# Altium schematic sheet USB-Sheet.SchDoc
size 420 x 297 mm; SheetNumber: 5; SheetTotal: 7
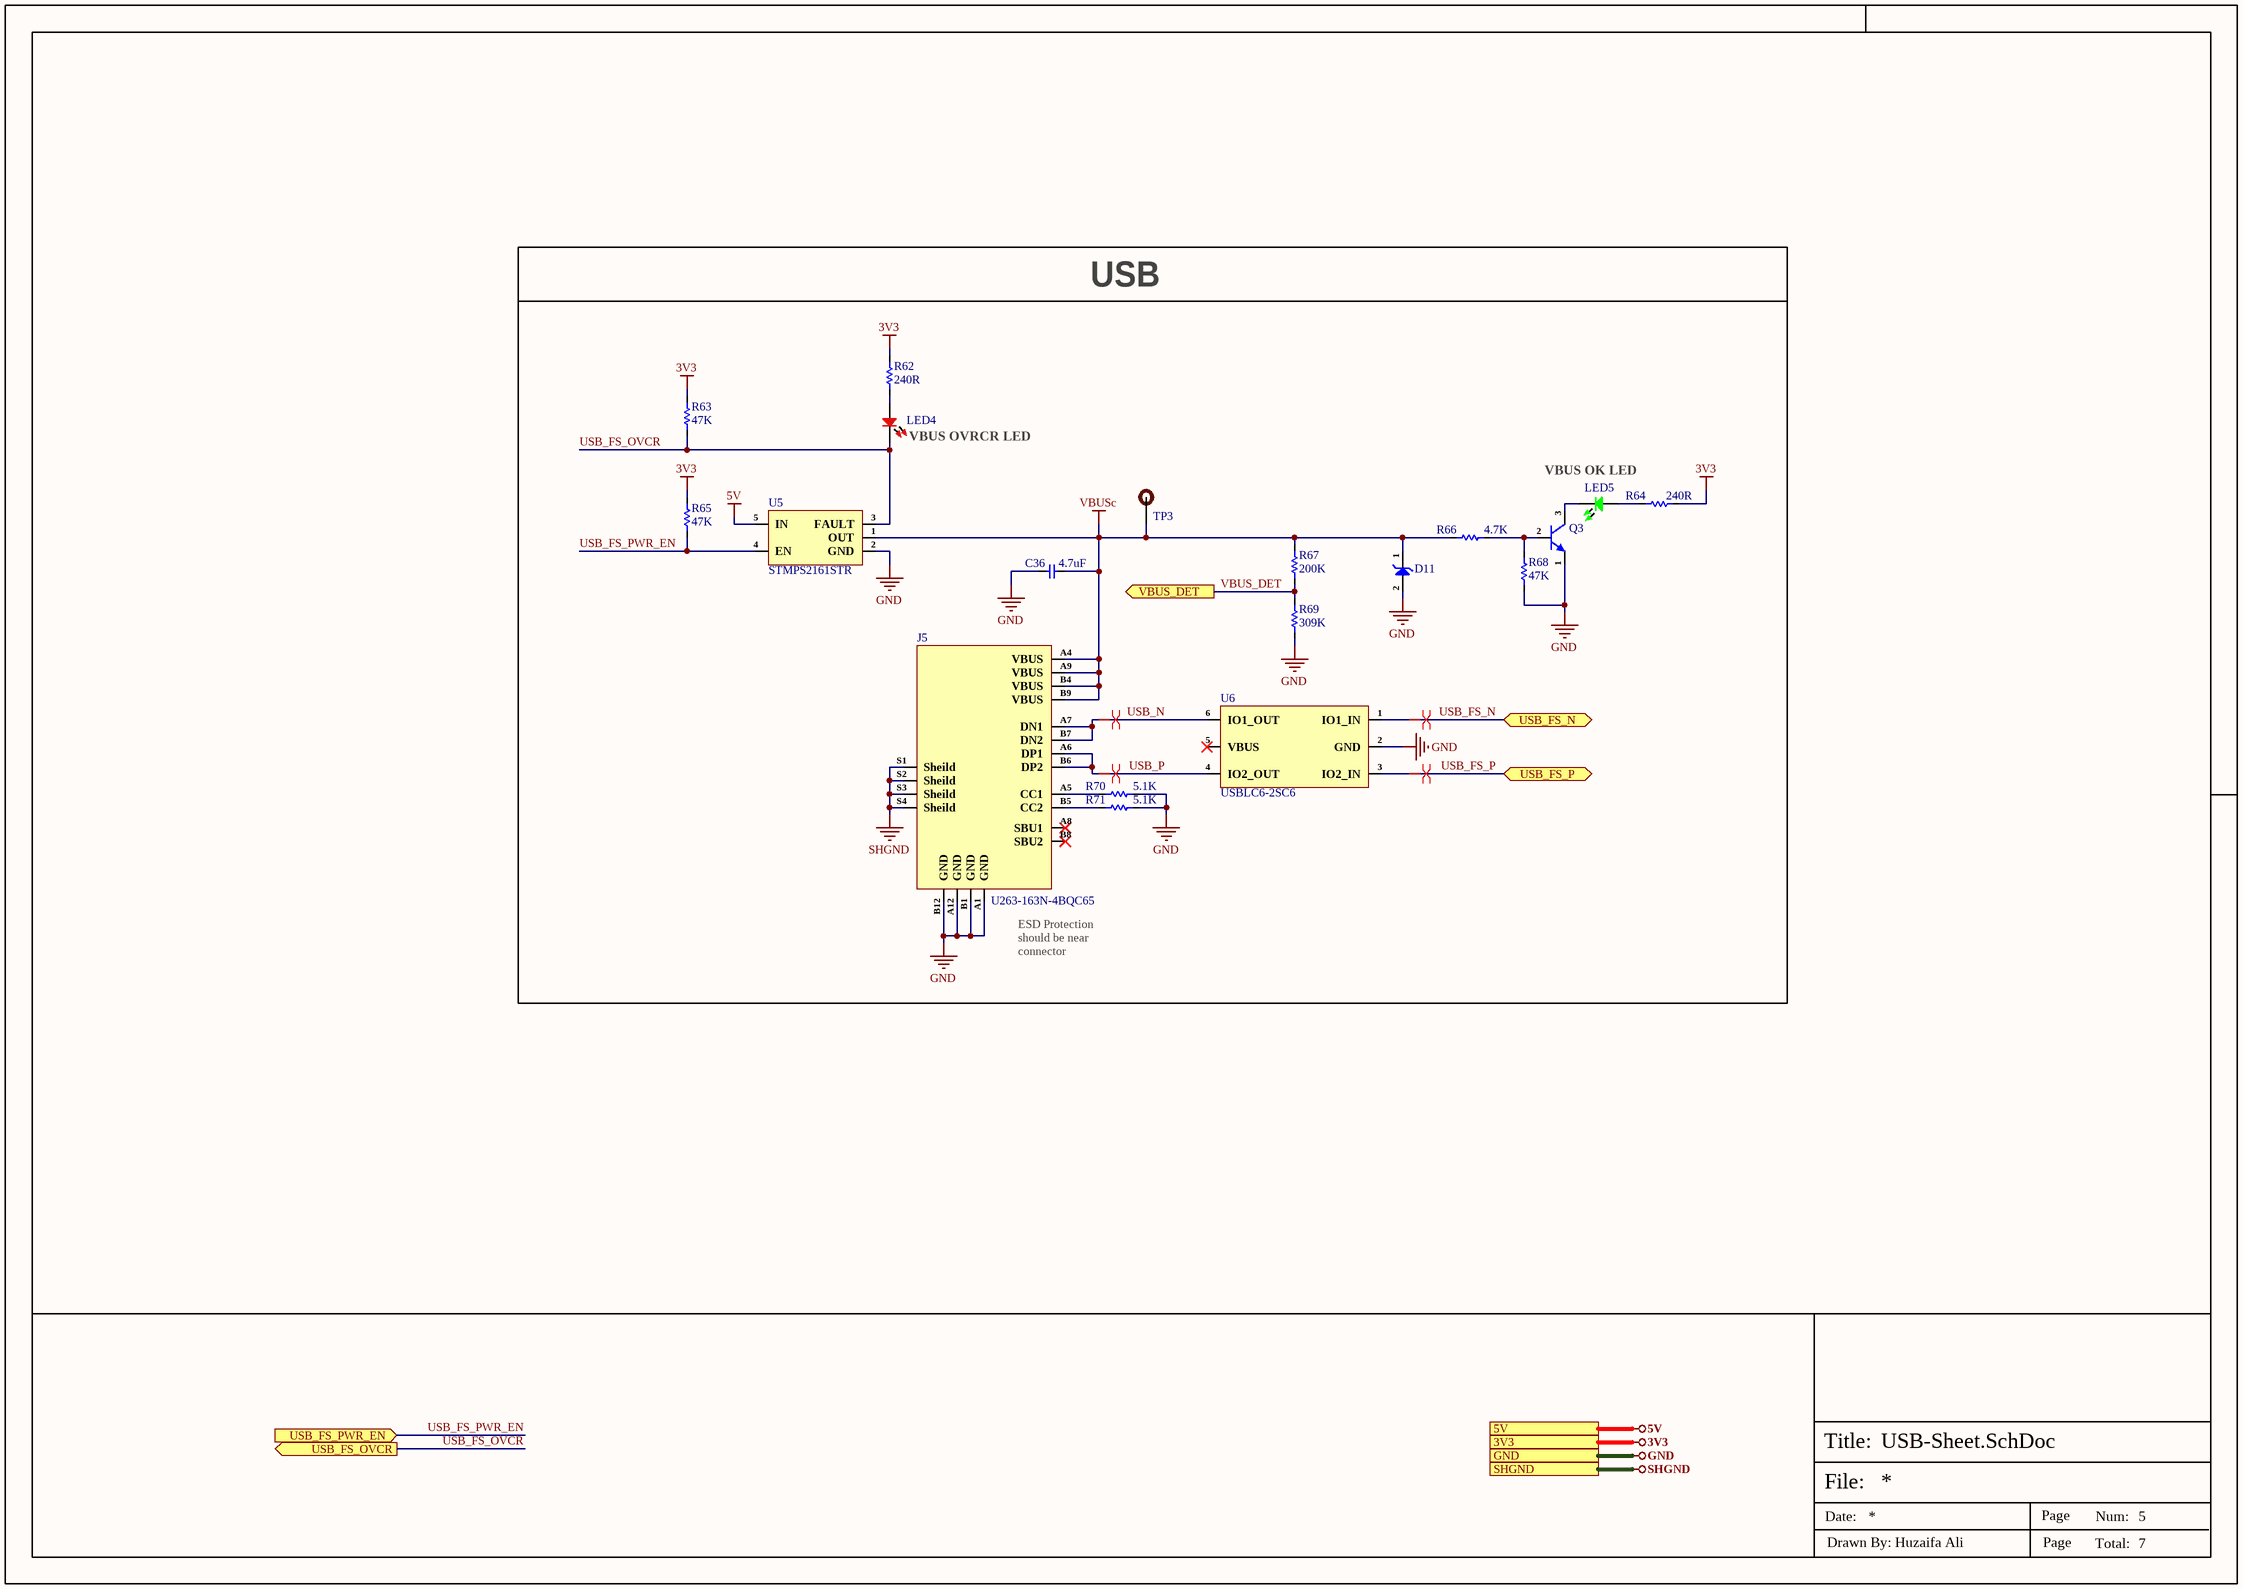
[diagram p0: USB-Sheet.SchDoc]

## Parts
C36  4.7uF  [Cap-0402]
D11  ESDA7P60-1U1M  [Diode 1610]  (value not drawn)
J5  U263-163N-4BQC65  [U263-163N-4BQC65]
LED4  RED  [LED-0603]  (value not drawn)
LED5  Emerald  [LED-0603]  (value not drawn)
Q3  MMBT3904  [SOT-23]  (value not drawn)
R62  240R  [Res-0402]
R63  47K  [Res-0402]
R64  240R  [Res-0402]
R65  47K  [Res-0402]
R66  4.7K  [Res-0402]
R67  200K  [Res-0402]
R68  47K  [Res-0402]
R69  309K  [Res-0402]
R70  5.1K  [Res-0402]
R71  5.1K  [Res-0402]
TP3  TEST POINT  [Test-point]  (value not drawn)  (no BOM)
U5  STMPS2161STR  [SOT-23-5]
U6  USBLC6-2SC6  [SOT-23-6]

## Ports
3V3 (see Top-Sheet[5B], BLDC-Driver-Sheet[5D], Comms-Sheet[4D], Controller-Sheet-1[4D], Controller-Sheet-2[4D], Power-Sheet[4D]), 5V (see Top-Sheet[5B], BLDC-Driver-Sheet[5D], Comms-Sheet[4D], Controller-Sheet-2[4D], Power-Sheet[4D]), GND (see Top-Sheet[5B], BLDC-Driver-Sheet[5D], Comms-Sheet[4D], Controller-Sheet-1[4D], Controller-Sheet-2[4D], Power-Sheet[4D]), SHGND (see Top-Sheet[5B], Power-Sheet[4D]), USB_FS_N (bidir, see Top-Sheet[5B], Controller-Sheet-2[2B]), USB_FS_OVCR (out, see Top-Sheet[5B], Controller-Sheet-2[2B]), USB_FS_P (bidir, see Top-Sheet[5B], Controller-Sheet-2[2B]), USB_FS_PWR_EN (in, see Top-Sheet[5B], Controller-Sheet-2[2B]), VBUS_DET (out, see Top-Sheet[5B], Controller-Sheet-2[2B])

## Nets
3V3: R62.2 R63.2 R64.2 R65.2 ; port 3V3
5V: U5.5(IN) ; port 5V
GND: C36.2 D11.2(A) J5.A1(GND) J5.A12(GND) J5.B1(GND) J5.B12(GND) Q3.1(E) R68.1 R69.1 R70.2 R71.2 U5.2(GND) U6.2(GND) ; port GND
SHGND: J5.S1(Sheild) J5.S2(Sheild) J5.S3(Sheild) J5.S4(Sheild) ; port SHGND
VBUSc: C36.1 D11.1(K) J5.A4(VBUS) J5.A9(VBUS) J5.B4(VBUS) J5.B9(VBUS) R66.1 R67.2 TP3.1 U5.1(OUT)
USB_FS_N: U6.1(IO1_IN) ; port USB_FS_N
USB_FS_OVCR: LED4.2 R63.1 U5.3(FAULT) ; port USB_FS_OVCR
USB_FS_P: U6.3(IO2_IN) ; port USB_FS_P
USB_FS_PWR_EN: R65.1 U5.4(EN) ; port USB_FS_PWR_EN
USB_N: J5.A7(DN1) J5.B7(DN2) U6.6(IO1_OUT)
USB_P: J5.A6(DP1) J5.B6(DP2) U6.4(IO2_OUT)
VBUS_DET: R67.1 R69.2 ; port VBUS_DET
NetJ5_A5: J5.A5(CC1) R70.1
NetJ5_B5: J5.B5(CC2) R71.1
NetLED4_1: LED4.1 R62.1
NetLED5_1: LED5.1 R64.1
NetLED5_2: LED5.2 Q3.3(C)
NetQ3_2: Q3.2(B) R66.2 R68.2

Not connected (* = marked no-connect by the designer): J5 A8(SBU1)* B8(SBU2)*; U6 5(VBUS)*

## Layout directives
differential pair; differential pair class DIFF_USB: USB_FS_N, USB_FS_P, USB_N, USB_P

## Notes on the sheet
- USB
- VBUS OVRCR LED
- VBUS OK LED
- (near J5) ESD Protection should be near connector
- File:
- Title:
- Date:
- Page
- Num:
- Total:
- Drawn By: Huzaifa Ali

## Library data of the parts
C36 = CC0402KRX5R6BB475: CAP CER 4.7UF 10V X5R 0402; Manufacturer: Yageo; Tolerance: 10%; Supplier 1: Farnell; Manufacturer Part Number: CC0402KRX5R6BB475; RoHS: Yes; Category: Ceramic Capacitors; Stock 1: 20000; Pricing 1: 10000=0.02310, 50000=0.02100 (GBP); Mount: Surface Mount; Case/Package: 0402; Case Code (Imperial): 0402; Case Code (Metric): 1005; Min Operating Temperature: -55°C; Max Operating Temperature: 85°C; Packaging: Cut Tape; Capacitance: 4.7uF; Voltage Rating: 10V; RoHS Compliant: Yes; ComponentLink1URL: http://www.yageo.com/documents/recent/UPY-GPHC_X5R_4V-to-50V_25.pdf?src-supplier=Digi-Key; ComponentLink1Description: http://www.yageo.com/documents/recent/UPY-GPHC_X5R_4V-to-50V_25.pdf?src-supplier=Digi-Key; Supplier Part Number 1: 3871698; LCSC Part Number: C326586
D11 = ESDA7P60-1U1M: TVS DIODE 5VWM 11.6VC 1610; Manufacturer: STMicroelectronics; Item Type: TVS Diodes; Number of Unidirectional Channels: 1; Reverse Standoff Voltage: 5V; Min Breakdown Voltage: 6.4V; Peak Pulse Power: 700W; Power Line Protection: No; Polarity: Unidirectional; Max Breakdown Voltage: 7.2V; Peak Pulse Current: 60A; Diode Type: ZENER; Supplier: Mouser; LCSC Part Number: C1975146; Manufacturer Part Number: ESDA7P60-1U1M; RoHS: Yes; Stock: 24694; Pricing: 1=0.37, 10=0.245, 50=0.245, 100=0.166, 1000=0.097, 10000=0.077 (USD); Mounting Technology: Surface Mount; Case/Package: 0603; Pins: 2; Case Code (Imperial): 0603; Case Code (Metric): 1610; Min Operating Temperature: -55°C; Max Operating Temperature: 150°C; Packaging: Cut Tape; Series: ESDA; Reach SVHC Compliant: No; RoHS Compliant: Yes; ComponentLink1URL: http://www.farnell.com/datasheets/2041290.pdf?src-supplier=Farnell; ComponentLink1Description: http://www.farnell.com/datasheets/2041290.pdf?src-supplier=Farnell; ComponentLink2URL: http://www.farnell.com/datasheets/2041290.pdf?src-supplier=Element14; ComponentLink2Description: http://www.farnell.com/datasheets/2041290.pdf?src-supplier=Element14; ComponentLink3URL: http://www.st.com/content/ccc/resource/technical/document/datasheet/44/e9/26/44/42/ee/4f/e5/DM00139972.pdf/files/DM00139972.pdf/jcr:content/translations/en.DM00139972.pdf?src-supplier=Digikey; ComponentLink3Description: http://www.st.com/content/ccc/resource/technical/document/datasheet/44/e9/26/44/42/ee/4f/e5/DM00139972.pdf/files/DM00139972.pdf/jcr:content/translations/en.DM00139972.pdf?src-supplier=Digikey
J5 = U263-163N-4BQC65: 5A 1 16P Mother -25℃~+85℃ Type-C SMD USB Connectors ROHS; Manufacturer: XKB Connection; Manufacturer Part Number: U263-163N-4BQC65; Package: SMD; LCSC Part Number: C2938598; Item Type: USB Connectors; ComponentLink1Description: LCSC; ComponentLink1URL: https://www.lcsc.com/product-detail/USB-Connectors_XKB-Connection-U263-163N-4BQC65_C2938598.html
LED4 = NCD0603R3: RED LED 0603 Light Emitting Diodes; Manufacturer: Foshan NationStar Optoelectronics; Manufacturer Part Number: NCD0603R3; Package: 0603; Item Type: LED; LCSC Part Number: C3151730; ComponentLink1Description: LCSC; ComponentLink1URL: https://www.lcsc.com/product-detail/Light-Emitting-Diodes-LED_Foshan-NationStar-Optoelectronics-NCD0603R3_C3151730.html
LED5 = NCD0603G2: Emerald 0603 Light Emitting Diodes (LED) ROHS; Manufacturer: Foshan NationStar Optoelectronics; Manufacturer Part Number: NCD0603G2; Package: 0603; LCSC Part Number: C87326; Item Type: LED; ComponentLink1Description: LCSC; ComponentLink1URL: https://www.lcsc.com/product-detail/Light-Emitting-Diodes-LED_Foshan-NationStar-Optoelectronics-NCD0603G2_C87326.html
Q3 = MMBT3904: 40V 200mW 100 200mA NPN SOT-23 Bipolar (BJT) ROHS; Manufacturer: ElecSuper; Item Type: (BJT); Manufacturer Part Number: MMBT3904; Package: SOT-23; LCSC Part Number: C5249683; ComponentLink1Description: LCSC; ComponentLink1URL: https://www.lcsc.com/product-detail/Bipolar-BJT_ElecSuper-MMBT3904_C5249683.html
R62 R64 = RC0402FR-07240RL: RES 240 OHM 1% 1/16W 0402; Manufacturer: Yageo; Item Type: Resistors; Power Rating: 63mW; Temperature Coefficient: 100ppm/°C; Voltage Rating (DC): 50V; Supplier 1: Mouser; Manufacturer Part Number: RC0402FR-07240RL; RoHS: Yes; Stock 1: 1903202; Pricing 1: 1=0.10000, 10=0.01200, 50=0.01200, 100=0.00500, 1000=0.00300, 10000=0.00100 (USD); Case/Package: 0402; Case Code (Metric): 1005; Case Code (Imperial): 0402; Size Code: 0402; Min Operating Temperature: -55°C; Max Operating Temperature: 155°C; Resistance: 240R; Tolerance: 1%; Packaging: Tape and Reel; Resistor Type: Thick Film; Voltage Rating: 50V; Package Quantity: 1; Number of Terminations: 2; Termination: SMD/SMT; Max Power Dissipation: 63mW; Features: Moisture Resistant; Series: RC; Construction: Rectangular; Resistance Tolerance: 1%; Length: 1mm; Width: 0.02inch; Height: 0.016inch; Depth: 0.5mm; REACH SVHC: Unknown; Lead Free: Lead Free; RoHS Compliant: Yes; Military Standard: Not; ComponentLink1URL: https://datasheet.ciiva.com/7849/1018594-7849915.pdf?src-supplier=Element14; ComponentLink1Description: https://datasheet.ciiva.com/7849/1018594-7849915.pdf?src-supplier=Element14; ComponentLink2URL: https://datasheet.ciiva.com/7849/1018594-7849916.pdf?src-supplier=Element14; ComponentLink2Description: https://datasheet.ciiva.com/7849/1018594-7849916.pdf?src-supplier=Element14; ComponentLink3URL: https://datasheet.ciiva.com/2519/pyu-r-int-thick-7-2519157.pdf?src-supplier=Digi-Key; ComponentLink3Description: https://datasheet.ciiva.com/2519/pyu-r-int-thick-7-2519157.pdf?src-supplier=Digi-Key; ComponentLink4URL: https://datasheet.ciiva.com/2519/pyu-r-int-thick-7-2519158.pdf?src-supplier=Digi-Key; ComponentLink4Description: https://datasheet.ciiva.com/2519/pyu-r-int-thick-7-2519158.pdf?src-supplier=Digi-Key; ComponentLink5URL: https://datasheet.ciiva.com/2519/pyu-r-int-thick-7-2519156.pdf?src-supplier=Digi-Key; ComponentLink5Description: https://datasheet.ciiva.com/2519/pyu-r-int-thick-7-2519156.pdf?src-supplier=Digi-Key; ComponentLink6URL: https://datasheet.ciiva.com/12669/pyu-rc0402-51-rohs-l-6-r-12669689.pdf?src-supplier=Mouser; ComponentLink6Description: https://datasheet.ciiva.com/12669/pyu-rc0402-51-rohs-l-6-r-12669689.pdf?src-supplier=Mouser; ComponentLink7URL: https://datasheet.ciiva.com/17419/pyu-rc0402-51-rohs-l-6-r-17419482.pdf?src-supplier=Future+Electronics; ComponentLink7Description: https://datasheet.ciiva.com/17419/pyu-rc0402-51-rohs-l-6-r-17419482.pdf?src-supplier=Future+Electronics; Supplier Part Number 1: 603-RC0402FR-07240RL; LCSC Part Number: C114755
R63 R65 R68 = RC0402FR-0747KL: RES 47K OHM 1% 1/16W 0402; Manufacturer: Yageo; Power Rating: 62.5mW; Temperature Coefficient: 100ppm/°C; Voltage Rating: 50V; Resistance: 47kR; Max Power Dissipation: 63mW; Item Type: Resistor; Supplier 1: Avnet; Manufacturer Part Number: RC0402FR-0747KL; RoHS: Yes; Category: Chip SMD Resistors; Stock 1: 680000; Pricing 1: 10000=0.00085, 20000=0.00087, 40000=0.00084, 60000=0.00083, 80000=0.00079, 100000=0.00078, 1000000=0.00076 (USD); Case/Package: 0402; Case Code (Imperial): 0402; Case Code (Metric): 1005; Size Code: 0402; Min Operating Temperature: -55°C; Max Operating Temperature: 155°C; Tolerance: 1%; Series: RC; Packaging: Tape and Reel; Package Quantity: 1; Termination: SMD/SMT; Resistor Type: Thick Film; Number of Terminations: 2; Features: Moisture Resistant; Resistance Tolerance: 1%; Construction: Rectangular; Length: 1mm; Width: 0.02inch; Height: 0.016inch; Depth: 0.5mm; RoHS Compliant: Yes; Military Standard: Not; Lead Free: Lead Free; ComponentLink1URL: https://datasheet.ciiva.com/46412/1018594-46412839.pdf?src-supplier=Element14; ComponentLink1Description: https://datasheet.ciiva.com/46412/1018594-46412839.pdf?src-supplier=Element14; ComponentLink2URL: https://datasheet.ciiva.com/2453/pyu-r-int-thick-7-2453389.pdf?src-supplier=Digi-Key; ComponentLink2Description: https://datasheet.ciiva.com/2453/pyu-r-int-thick-7-2453389.pdf?src-supplier=Digi-Key; ComponentLink3URL: https://datasheet.ciiva.com/2453/pyu-r-int-thick-7-2453390.pdf?src-supplier=Digi-Key; ComponentLink3Description: https://datasheet.ciiva.com/2453/pyu-r-int-thick-7-2453390.pdf?src-supplier=Digi-Key; ComponentLink4URL: https://datasheet.ciiva.com/2453/pyu-r-int-thick-7-2453388.pdf?src-supplier=Digi-Key; ComponentLink4Description: https://datasheet.ciiva.com/2453/pyu-r-int-thick-7-2453388.pdf?src-supplier=Digi-Key; ComponentLink5URL: https://datasheet.ciiva.com/15189/getdatasheetpartid-323748-15189466.pdf?src-supplier=Verical; ComponentLink5Description: https://datasheet.ciiva.com/15189/getdatasheetpartid-323748-15189466.pdf?src-supplier=Verical; ComponentLink6URL: https://datasheet.ciiva.com/16793/pyu-rc0402-51-rohs-l-6-r-16793430.pdf?src-supplier=Future+Electronics; ComponentLink6Description: https://datasheet.ciiva.com/16793/pyu-rc0402-51-rohs-l-6-r-16793430.pdf?src-supplier=Future+Electronics; Supplier Part Number 1: RC0402FR-0747KL; LCSC Part Number: C93943
R66 = RC0402FR-074K7L: RES 4.7K OHM 1% 1/16W 0402; Manufacturer: Yageo; Voltage Rating (DC): 50V; Power Rating: 62.5mW; Resistance: 4.7kR; Temperature Coefficient: 100ppm/°C; Max Power Dissipation: 63mW; Item Type: Resistor; Supplier 1: Avnet; Manufacturer Part Number: RC0402FR-074K7L; RoHS: Yes; Category: Chip SMD Resistors; Stock 1: 2420000; Pricing 1: 10000=0.00085 (USD); Case/Package: 0402; Number of Pins: 2; Case Code (Imperial): 0402; Case Code (Metric): 1005; Size Code: 0402; Min Operating Temperature: -55°C; Max Operating Temperature: 155°C; Tolerance: 1%; Voltage Rating: 50V; Packaging: Tape and Reel; Resistor Type: Thick Film; Termination: SMD/SMT; Features: Moisture Resistant; Series: RC; Number of Terminations: 2; Resistance Tolerance: 1%; Construction: Rectangular; Length: 1mm; Width: 0.5mm; Height: 0.32mm; Depth: 0.5mm; Height - Seated (Max): 0.016inch; RoHS Compliant: Yes; Reach SVHC Compliant: Yes; Military Standard: Not; Lead Free: Lead Free; ComponentLink1URL: https://datasheet.ciiva.com/22661/1686128-22661342.pdf?src-supplier=Element14; ComponentLink1Description: https://datasheet.ciiva.com/22661/1686128-22661342.pdf?src-supplier=Element14; ComponentLink2URL: https://datasheet.ciiva.com/7850/1018594-7850022.pdf?src-supplier=Element14; ComponentLink2Description: https://datasheet.ciiva.com/7850/1018594-7850022.pdf?src-supplier=Element14; ComponentLink3URL: https://datasheet.ciiva.com/7850/1018594-7850023.pdf?src-supplier=Element14; ComponentLink3Description: https://datasheet.ciiva.com/7850/1018594-7850023.pdf?src-supplier=Element14; ComponentLink4URL: https://datasheet.ciiva.com/15215/getdatasheetpartid-328119-15215035.pdf?src-supplier=Verical; ComponentLink4Description: https://datasheet.ciiva.com/15215/getdatasheetpartid-328119-15215035.pdf?src-supplier=Verical; Supplier Part Number 1: RC0402FR-074K7L; LCSC Part Number: C105871
R67 = RC0402FR-07200KL: RES 200K OHM 1% 1/16W 0402; Manufacturer: Yageo; Item Type: Resistor; Power Rating: 63mW; Temperature Coefficient: 100ppm/°C; Value: 200kR; Voltage Rating: 50V; Supplier: Future Electronics; LCSC Part Number: C114763; Manufacturer Part Number: RC0402FR-07200KL; RoHS: Yes; Stock: 290000; Pricing: 10000=0.0004, 50000=0.0008, 150000=0.0004, 300000=0.0007, 400000=0.0004, 1000000=0.0004, 2500000=0.0004, 3000000=0.0006 (USD); Case/Package: 0402; Case Code (Metric): 1005; Case Code (Imperial): 0402; Min Operating Temperature: -55°C; Max Operating Temperature: 155°C; Tolerance: 1%; Packaging: Tape and Reel; Termination: SMD/SMT; Series: RC; Technology: THICK FILM; Package Quantity: 1; Resistor Type: Thick Film; Number of Terminations: 2; Max Power Dissipation: 63mW; Working Voltage: 50V; Features: Moisture Resistant; Construction: Rectangular; Resistance Tolerance: 1%; Voltage Rating (DC): 50V; Length: 0.039inch; Width: 0.02inch; Height: 0.016inch; Depth: 0.5mm; RoHS Compliant: Yes; Lead Free: 5697LeadFree; Military Standard: Not; Reach SVHC Compliant: Unknown; ComponentLink1URL: https://datasheet.ciiva.com/7849/1018594-7849897.pdf?src-supplier=Element14; ComponentLink1Description: https://datasheet.ciiva.com/7849/1018594-7849897.pdf?src-supplier=Element14; ComponentLink2URL: https://datasheet.ciiva.com/7849/1018594-7849896.pdf?src-supplier=Element14; ComponentLink2Description: https://datasheet.ciiva.com/7849/1018594-7849896.pdf?src-supplier=Element14; ComponentLink3URL: https://datasheet.ciiva.com/46394/1018594-46394953.pdf?src-supplier=Element14; ComponentLink3Description: https://datasheet.ciiva.com/46394/1018594-46394953.pdf?src-supplier=Element14; ComponentLink4URL: https://datasheet.ciiva.com/2453/pyu-r-int-thick-7-2453557.pdf?src-supplier=Digikey; ComponentLink4Description: https://datasheet.ciiva.com/2453/pyu-r-int-thick-7-2453557.pdf?src-supplier=Digikey; ComponentLink5URL: https://datasheet.ciiva.com/2453/pyu-r-int-thick-7-2453558.pdf?src-supplier=Digikey; ComponentLink5Description: https://datasheet.ciiva.com/2453/pyu-r-int-thick-7-2453558.pdf?src-supplier=Digikey; ComponentLink6URL: https://datasheet.ciiva.com/2453/pyu-r-int-thick-7-2453556.pdf?src-supplier=Digikey; ComponentLink6Description: https://datasheet.ciiva.com/2453/pyu-r-int-thick-7-2453556.pdf?src-supplier=Digikey; ComponentLink7URL: https://datasheet.ciiva.com/12667/pyu-rc0402-51-rohs-l-6-r-12667911.pdf?src-supplier=Mouser; ComponentLink7Description: https://datasheet.ciiva.com/12667/pyu-rc0402-51-rohs-l-6-r-12667911.pdf?src-supplier=Mouser; ComponentLink8URL: https://datasheet.ciiva.com/15189/getdatasheetpartid-323720-15189381.pdf?src-supplier=Verical; ComponentLink8Description: https://datasheet.ciiva.com/15189/getdatasheetpartid-323720-15189381.pdf?src-supplier=Verical; ComponentLink9URL: https://datasheet.ciiva.com/16740/pyu-rc0402-51-rohs-l-6-r-16740636.pdf?src-supplier=Future+Electronics; ComponentLink9Description: https://datasheet.ciiva.com/16740/pyu-rc0402-51-rohs-l-6-r-16740636.pdf?src-supplier=Future+Electronics
R69 = RC0402FR-07309KL: RES 309K OHM 1% 1/16W 0402; Manufacturer: Yageo; Value: 309kR; Temperature Coefficient: 100ppm/°C; Power Rating: 62.5mW; Voltage Rating: 50V; Max Power Dissipation: 63mW; Item Type: Resistor; Supplier: Future Electronics; Supplier Part Number: 2108207; Manufacturer Part Number: RC0402FR-07309KL; RoHS: Yes; Category: Chip SMD Resistors; Stock: 10000; Pricing: 10000=0.0012, 100000=0.0011, 400000=0.0011, 1250000=0.001, 4000000=0.0009 (USD); Case/Package: 0402; Contact Plating: Tin,Matte; Case Code (Imperial): 0402; Case Code (Metric): 1005; Min Operating Temperature: -55°C; Max Operating Temperature: 155°C; Tolerance: 1%; Packaging: Tape and Reel; Number of Terminations: 2; Termination: SMD/SMT; Voltage Rating (DC): 50V; Working Voltage: 50V; Features: Moisture Resistant; Series: RC; Technology: THICK FILM; Length: 0.039inch; Width: 0.5mm; Height: 0.016inch; Lead Free: Lead Free; RoHS Compliant: Yes; ComponentLink1URL: https://datasheet.ciiva.com/16743/pyu-rc0402-51-rohs-l-6-r-16743925.pdf?src-supplier=Future+Electronics; ComponentLink1Description: https://datasheet.ciiva.com/16743/pyu-rc0402-51-rohs-l-6-r-16743925.pdf?src-supplier=Future+Electronics; ComponentLink2URL: https://datasheet.ciiva.com/8886/pyu-rc0402-51-rohs-l-6-8886246.pdf?src-supplier=Avnet; ComponentLink2Description: https://datasheet.ciiva.com/8886/pyu-rc0402-51-rohs-l-6-8886246.pdf?src-supplier=Avnet; LCSC Part Number: C171694
R70 R71 = RC0402FR-075K1L: RES 5.1K OHM 1% 1/16W 0402; Manufacturer: Yageo; Power Rating: 63mW; Resistance: 5.1kR; Temperature Coefficient: 100ppm/°C; Voltage Rating: 50V; Item Type: Resistor; Supplier 1: Avnet; Manufacturer Part Number: RC0402FR-075K1L; RoHS: Yes; Category: Chip SMD Resistors; Stock 1: 65000; Pricing 1: 10000=0.00085 (USD); Case/Package: 0402; Case Code (Metric): 1005; Case Code (Imperial): 0402; Min Operating Temperature: -55°C; Max Operating Temperature: 155°C; Tolerance: 1%; Technology: THICK FILM; Packaging: Tape and Reel; Package Quantity: 1; Resistor Type: Thick Film; Number of Terminations: 2; Termination: SMD/SMT; Max Power Dissipation: 63mW; Voltage Rating (DC): 50V; Working Voltage: 50V; Features: Moisture Resistant; Series: RC; Resistance Tolerance: 1%; Construction: Rectangular; Length: 1mm; Width: 0.02inch; Height: 0.016inch; Depth: 0.5mm; RoHS Compliant: Yes; Military Standard: Not; Lead Free: Lead Free; ComponentLink1URL: https://datasheet.ciiva.com/7983/1018594-7983519.pdf?src-supplier=Element14; ComponentLink1Description: https://datasheet.ciiva.com/7983/1018594-7983519.pdf?src-supplier=Element14; ComponentLink2URL: https://datasheet.ciiva.com/46394/1018594-46394936.pdf?src-supplier=Element14; ComponentLink2Description: https://datasheet.ciiva.com/46394/1018594-46394936.pdf?src-supplier=Element14; ComponentLink3URL: https://datasheet.ciiva.com/2453/pyu-r-int-thick-7-2453401.pdf?src-supplier=Digi-Key; ComponentLink3Description: https://datasheet.ciiva.com/2453/pyu-r-int-thick-7-2453401.pdf?src-supplier=Digi-Key; ComponentLink4URL: https://datasheet.ciiva.com/2453/pyu-r-int-thick-7-2453402.pdf?src-supplier=Digi-Key; ComponentLink4Description: https://datasheet.ciiva.com/2453/pyu-r-int-thick-7-2453402.pdf?src-supplier=Digi-Key; ComponentLink5URL: https://datasheet.ciiva.com/2453/pyu-r-int-thick-7-2453400.pdf?src-supplier=Digi-Key; ComponentLink5Description: https://datasheet.ciiva.com/2453/pyu-r-int-thick-7-2453400.pdf?src-supplier=Digi-Key; ComponentLink6URL: https://datasheet.ciiva.com/12558/pyu-rc0402-51-rohs-l-6-r-8721-12558460.pdf?src-supplier=Mouser; ComponentLink6Description: https://datasheet.ciiva.com/12558/pyu-rc0402-51-rohs-l-6-r-8721-12558460.pdf?src-supplier=Mouser; ComponentLink7URL: https://datasheet.ciiva.com/16744/pyu-rc0402-51-rohs-l-6-r-16744283.pdf?src-supplier=Future+Electronics; ComponentLink7Description: https://datasheet.ciiva.com/16744/pyu-rc0402-51-rohs-l-6-r-16744283.pdf?src-supplier=Future+Electronics; ComponentLink8URL: https://datasheet.ciiva.com/15189/getdatasheetpartid-323636-15189493.pdf?src-supplier=Verical; ComponentLink8Description: https://datasheet.ciiva.com/15189/getdatasheetpartid-323636-15189493.pdf?src-supplier=Verical; Supplier Part Number 1: RC0402FR-075K1L; LCSC Part Number: C105872
TP3 = TEST POINT: Test Point ON; Item Type: TEST POINT
U5 = STMPS2161STR: IC PWR SWITCH N-CHAN 1:1 SOT23-5; Manufacturer: STMicroelectronics; Drain to Source Resistance: 90mR; Max Supply Voltage: 5.5V; Min Supply Voltage: 2.7V; Nominal Supply Voltage: 5V; Number of Channels: 1NUMBER; Supplier: Future Electronics; LCSC Part Number: C361034; Manufacturer Part Number: STMPS2161STR; RoHS: Yes; Item Type: IC; Stock: 3000; Pricing: 3000=0.42, 6000=0.41, 9000=0.405, 12000=0.405, 15000=0.395 (USD); Output Voltage: 5V; Height: 1.45mm; ComponentLink1URL: https://datasheet.ciiva.com/4923/cd00167470-116695-4923505.pdf?src-supplier=Mouser; ComponentLink1Description: https://datasheet.ciiva.com/4923/cd00167470-116695-4923505.pdf?src-supplier=Mouser; ComponentLink2URL: https://datasheet.ciiva.com/15108/getdatasheetpartid-66027-15108935.pdf?src-supplier=Verical; ComponentLink2Description: https://datasheet.ciiva.com/15108/getdatasheetpartid-66027-15108935.pdf?src-supplier=Verical; ComponentLink3URL: https://datasheet.ciiva.com/1962/cd00167470-1962487.pdf?src-supplier=Digikey; ComponentLink3Description: https://datasheet.ciiva.com/1962/cd00167470-1962487.pdf?src-supplier=Digikey; ComponentLink4URL: https://datasheet.ciiva.com/1962/cd00167470-1962488.pdf?src-supplier=Digikey; ComponentLink4Description: https://datasheet.ciiva.com/1962/cd00167470-1962488.pdf?src-supplier=Digikey; ComponentLink5URL: https://datasheet.ciiva.com/1962/cd00167470-1962489.pdf?src-supplier=Digikey; ComponentLink5Description: https://datasheet.ciiva.com/1962/cd00167470-1962489.pdf?src-supplier=Digikey; ComponentLink6URL: https://datasheet.ciiva.com/1512/1700527-1512630.pdf?src-supplier=Element14; ComponentLink6Description: https://datasheet.ciiva.com/1512/1700527-1512630.pdf?src-supplier=Element14; ComponentLink7URL: https://datasheet.ciiva.com/16491/cd00167470-16491224.pdf?src-supplier=Future+Electronics; ComponentLink7Description: https://datasheet.ciiva.com/16491/cd00167470-16491224.pdf?src-supplier=Future+Electronics; ComponentLink8URL: https://datasheet.ciiva.com/41457/001185713-da-01-en-ic-pwr-switch-stmps2161str-sot-23-5-stm-41457482.pdf?src-supplier=Conrad; ComponentLink8Description: https://datasheet.ciiva.com/41457/001185713-da-01-en-ic-pwr-switch-stmps2161str-sot-23-5-stm-41457482.pdf?src-supplier=Conrad
U6 = USBLC6-2SC6: 6A 12V 150W 6V Unidirectional 5V SOT-23-6 ESD and Surge Protection (TVS/ESD) ROHS; Manufacturer: TECH PUBLIC; Manufacturer Part Number: USBLC6-2SC6; Package: SOT-23-6; LCSC Part Number: C2827654; Item Type: (TVS/ESD); ComponentLink1Description: LCSC; ComponentLink1URL: https://www.lcsc.com/product-detail/ESD-and-Surge-Protection-TVS-ESD_TECH-PUBLIC-USBLC6-2SC6_C2827654.html